# Altium schematic sheet Title_Block.SchDoc
size 381 x 241 mm; SheetNumber: 1; SheetTotal: 1
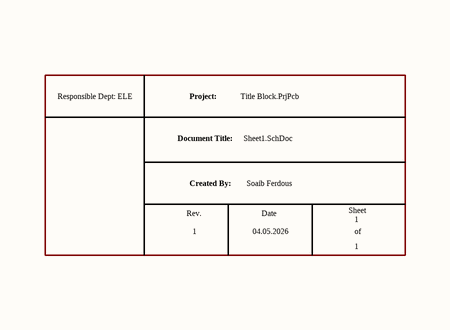
[diagram p0: Title_Block.SchDoc]

## Parts
?  (no value)  (graphical)

## Notes on the sheet
- (in symbol HSHL Title Block) Responsible Dept: ELE; Project:; Title Block.PrjPcb; Document Title:; Sheet1.SchDoc; Created By:; Soaib Ferdous; Sheet; Rev.; Date; 1; 04.05.2026; of

## Library data of the parts
? = HSHL Title Block